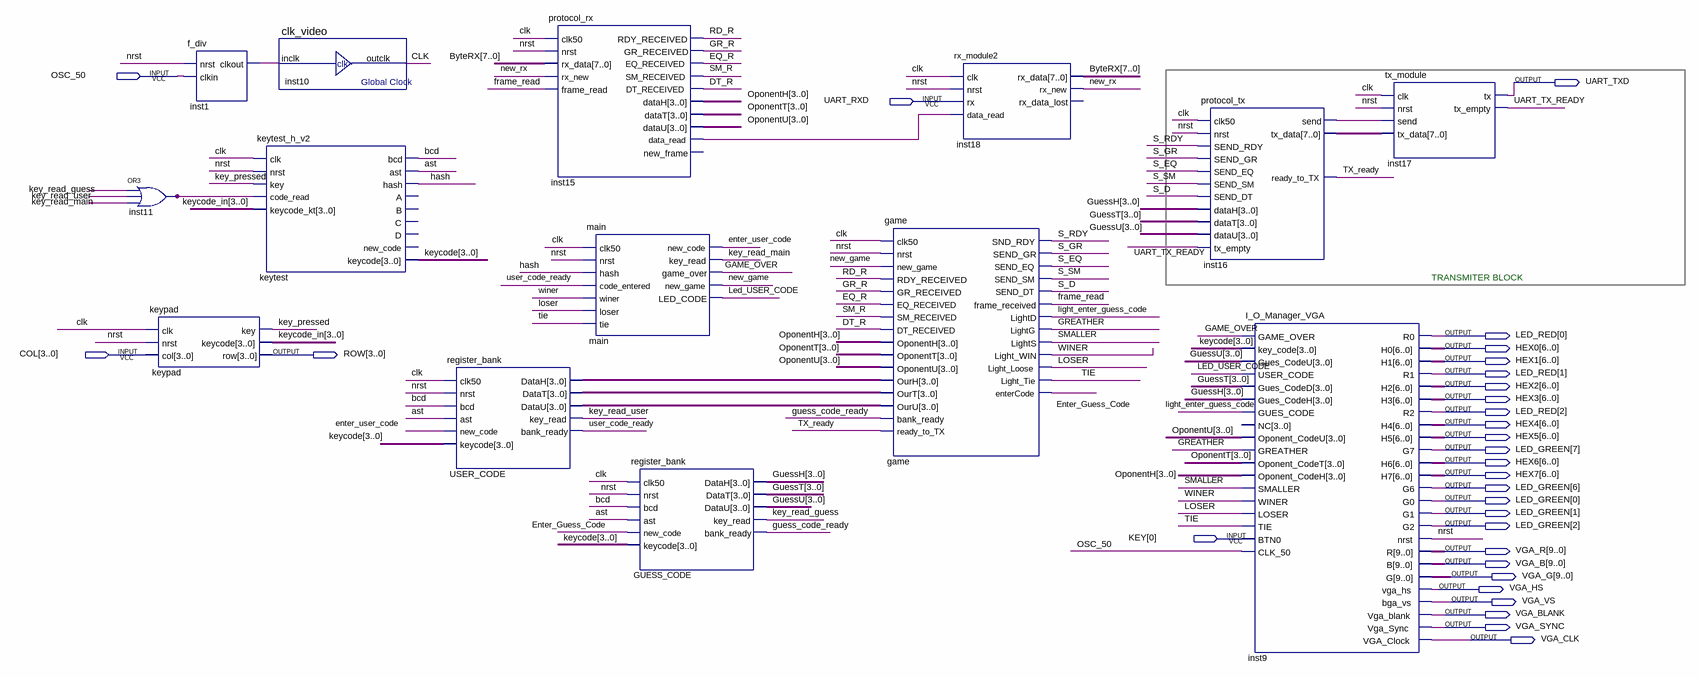
[diagram p0: schematic sheet]
// Quartus schematic P1_BOARD_vga.bdf as structural Verilog: 14 symbols, 30 pins
module P1_BOARD_vga (
  input  OSC_50,
  input  UART_RXD,
  input  [3:0] COL,
  input  [0:0] KEY,
  output UART_TXD,
  output [2:0] LED_RED,
  output [6:0] HEX0,
  output [3:0] ROW,
  output [6:0] HEX1,
  output [6:0] HEX2,
  output [6:0] HEX3,
  output [6:0] HEX4,
  output [6:0] HEX5,
  output [7:0] LED_GREEN,
  output [6:0] HEX6,
  output [6:0] HEX7,
  output [9:0] VGA_R,
  output [9:0] VGA_B,
  output [9:0] VGA_G,
  output VGA_HS,
  output VGA_VS,
  output VGA_BLANK,
  output VGA_SYNC,
  output VGA_CLK
);

  wire ast, bcd, clk, DT_R, Enter_Guess_Code, enter_user_code, EQ_R, frame_read, GAME_OVER, GR_R, GREATHER,
       guess_code_ready, hash, inst1_clkout, inst11_out, inst15_data_read, inst16_send, key_pressed,
       key_read_guess, key_read_main, key_read_user, Led_USER_CODE, light_enter_guess_code, LOSER, new_game,
       new_rx, nrst, RD_R, S_D, S_EQ, S_GR, S_RDY, S_SM, SM_R, SMALLER, TIE, TX_ready, UART_TX_READY,
       user_code_ready, WINER;
  wire [3:0] GuessH, GuessT, GuessU, keycode, keycode_in, OponentH, OponentT, OponentU, USER_CODE_datah,
       USER_CODE_datat, USER_CODE_datau;
  wire [7:0] ByteRX, inst16_tx_data;

  or inst11 (inst11_out, key_read_guess, key_read_user, key_read_main);
  f_div inst1 (.nrst(nrst), .clkin(OSC_50), .clkout(inst1_clkout));
  keypad keypad (.clk(clk), .nrst(nrst), .col(COL), .key(key_pressed), .keycode(keycode_in), .row(ROW));
  clk_video inst10 (.inclk(inst1_clkout), .outclk(clk));
  keytest_h_v2 keytest (
    .clk(clk), .nrst(nrst), .key(key_pressed), .code_read(inst11_out), .keycode_kt(keycode_in), .bcd(bcd),
    .ast(ast), .hash(hash), .keycode(keycode));  // open: A, B, C, D, new_code
  register_bank USER_CODE (
    .clk50(clk), .nrst(nrst), .bcd(bcd), .ast(ast), .new_code(enter_user_code), .keycode(keycode),
    .DataH(USER_CODE_datah), .DataT(USER_CODE_datat), .DataU(USER_CODE_datau), .key_read(key_read_user),
    .bank_ready(user_code_ready));
  protocol_rx inst15 (
    .clk50(clk), .nrst(nrst), .rx_data(ByteRX), .rx_new(new_rx), .frame_read(frame_read),
    .RDY_RECEIVED(RD_R), .GR_RECEIVED(GR_R), .EQ_RECEIVED(EQ_R), .SM_RECEIVED(SM_R), .DT_RECEIVED(DT_R),
    .dataH(OponentH), .dataT(OponentT), .dataU(OponentU), .data_read(inst15_data_read));  // open: new_frame
  main main (
    .clk50(clk), .nrst(nrst), .hash(hash), .code_entered(user_code_ready), .winer(WINER), .loser(LOSER),
    .tie(TIE), .new_code(enter_user_code), .key_read(key_read_main), .game_over(GAME_OVER),
    .new_game(new_game), .LED_CODE(Led_USER_CODE));
  register_bank GUESS_CODE (
    .clk50(clk), .nrst(nrst), .bcd(bcd), .ast(ast), .new_code(Enter_Guess_Code), .keycode(keycode),
    .DataH(GuessH), .DataT(GuessT), .DataU(GuessU), .key_read(key_read_guess), .bank_ready(guess_code_ready));
  game game (
    .clk50(clk), .nrst(nrst), .new_game(new_game), .RDY_RECEIVED(RD_R), .GR_RECEIVED(GR_R),
    .EQ_RECEIVED(EQ_R), .SM_RECEIVED(SM_R), .DT_RECEIVED(DT_R), .bank_ready(guess_code_ready),
    .ready_to_TX(TX_ready), .OponentH(OponentH), .OponentT(OponentT), .OponentU(OponentU),
    .OurH(USER_CODE_datah), .OurT(USER_CODE_datat), .OurU(USER_CODE_datau), .SND_RDY(S_RDY), .SEND_GR(S_GR),
    .SEND_EQ(S_EQ), .SEND_SM(S_SM), .SEND_DT(S_D), .frame_received(frame_read),
    .LightD(light_enter_guess_code), .LightG(GREATHER), .LightS(SMALLER), .Light_WIN(WINER),
    .Light_Loose(LOSER), .Light_Tie(TIE), .enterCode(Enter_Guess_Code));
  rx_module2 inst18 (
    .clk(clk), .nrst(nrst), .rx(UART_RXD), .data_read(inst15_data_read), .rx_data(ByteRX), .rx_new(new_rx));  // open: rx_data_lost
  protocol_tx inst16 (
    .clk50(clk), .nrst(nrst), .SEND_RDY(S_RDY), .SEND_GR(S_GR), .SEND_EQ(S_EQ), .SEND_SM(S_SM),
    .SEND_DT(S_D), .dataH(GuessH), .dataT(GuessT), .dataU(GuessU), .tx_empty(UART_TX_READY),
    .tx_data(inst16_tx_data), .ready_to_TX(TX_ready), .send(inst16_send));
  I_O_Manager_VGA inst9 (
    .GAME_OVER(GAME_OVER), .key_code(keycode), .Gues_CodeU(GuessU), .USER_CODE(Led_USER_CODE),
    .Gues_CodeD(GuessT), .Gues_CodeH(GuessH), .GUES_CODE(light_enter_guess_code), .Oponent_CodeU(OponentU),
    .GREATHER(GREATHER), .Oponent_CodeT(OponentT), .Oponent_CodeH(OponentH), .SMALLER(SMALLER),
    .WINER(WINER), .LOSER(LOSER), .BTN0(KEY[0]), .TIE(TIE), .CLK_50(OSC_50), .R0(LED_RED[0]), .H0(HEX0),
    .H1(HEX1), .R1(LED_RED[1]), .H2(HEX2), .H3(HEX3), .R2(LED_RED[2]), .H4(HEX4), .H5(HEX5),
    .G7(LED_GREEN[7]), .H6(HEX6), .H7(HEX7), .G6(LED_GREEN[6]), .G0(LED_GREEN[0]), .G1(LED_GREEN[1]),
    .nrst(nrst), .G2(LED_GREEN[2]), .R(VGA_R), .B(VGA_B), .G(VGA_G), .vga_hs(VGA_HS), .bga_vs(VGA_VS),
    .Vga_blank(VGA_BLANK), .Vga_Sync(VGA_SYNC), .VGA_Clock(VGA_CLK));  // open: NC
  tx_module inst17 (
    .clk(clk), .nrst(nrst), .send(inst16_send), .tx_data(inst16_tx_data), .tx(UART_TXD),
    .tx_empty(UART_TX_READY));

  // Notes on the sheet:
  //   TRANSMITER BLOCK
  //   -
endmodule
